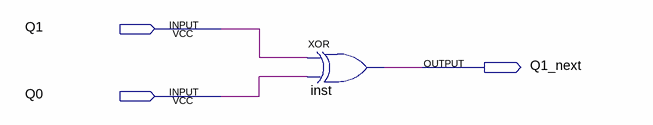
[diagram p0: schematic sheet]
// Quartus schematic Q1_next.bdf as structural Verilog: 1 symbols, 3 pins
module Q1_next (
  input  Q1,
  input  Q0,
  output Q1_next
);

  xor inst (Q1_next, Q1, Q0);
endmodule
